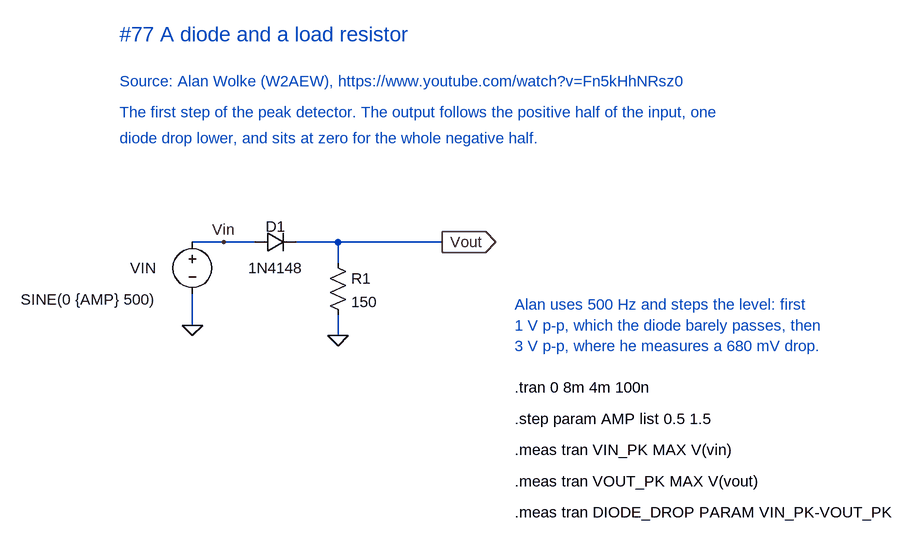
[diagram p0: schematic Diode voltage drop.asc]
Diode voltage drop.asc, the LTspice schematic file:
Version 4.1
SHEET 1 1100 700
WIRE 160 32 64 32
WIRE 288 32 224 32
WIRE 448 32 288 32
WIRE 64 160 64 112
WIRE 288 64 288 32
WIRE 288 176 288 144
FLAG 64 160 0
FLAG 288 176 0
FLAG 448 32 Vout
IOPIN 448 32 Out
FLAG 112 32 Vin
SYMBOL voltage 64 16 R0
WINDOW 123 0 0 Left 0
WINDOW 39 0 0 Left 0
WINDOW 0 -56 56 Right 2
WINDOW 3 -264 104 Left 2
SYMATTR InstName VIN
SYMATTR Value SINE(0 {AMP} 500)
SYMBOL diode 160 48 R270
WINDOW 0 24 32 VTop 2
WINDOW 3 -8 32 VBottom 2
SYMATTR InstName D1
SYMATTR Value 1N4148
SYMBOL res 272 48 R0
SYMATTR InstName R1
SYMATTR Value 150
TEXT -48 -288 Left 3 ;#77 A diode and a load resistor
TEXT -48 -216 Left 2 ;Source: Alan Wolke (W2AEW), https://www.youtube.com/watch?v=Fn5kHhNRsz0
TEXT -48 -168 Left 2 ;The first step of the peak detector. The output follows the positive half of the input, one
TEXT -48 -128 Left 2 ;diode drop lower, and sits at zero for the whole negative half.
TEXT 560 128 Left 2 ;Alan uses 500 Hz and steps the level: first
TEXT 560 160 Left 2 ;1 V p-p, which the diode barely passes, then
TEXT 560 192 Left 2 ;3 V p-p, where he measures a 680 mV drop.
TEXT 560 256 Left 2 !.tran 0 8m 4m 100n
TEXT 560 304 Left 2 !.step param AMP list 0.5 1.5
TEXT 560 352 Left 2 !.meas tran VIN_PK MAX V(vin)
TEXT 560 400 Left 2 !.meas tran VOUT_PK MAX V(vout)
TEXT 560 448 Left 2 !.meas tran DIODE_DROP PARAM VIN_PK-VOUT_PK

The netlist it stands for:
* Diode voltage drop.asc
VIN Vin 0 SINE(0 {AMP} 500)
D1 Vin Vout 1N4148
R1 Vout 0 150
.model D D
.lib standard.dio
* #77 A diode and a load resistor
* Source: Alan Wolke (W2AEW), https://www.youtube.com/watch?v=Fn5kHhNRsz0
* The first step of the peak detector. The output follows the positive half of the input, one
* diode drop lower, and sits at zero for the whole negative half.
* Alan uses 500 Hz and steps the level: first
* 1 V p-p, which the diode barely passes, then
* 3 V p-p, where he measures a 680 mV drop.
.tran 0 8m 4m 100n
.step param AMP list 0.5 1.5
.meas tran VIN_PK MAX V(vin)
.meas tran VOUT_PK MAX V(vout)
.meas tran DIODE_DROP PARAM VIN_PK-VOUT_PK
.backanno
.end